# Altium schematic sheet 300_Externals.SchDoc: External_Components
size A4; Date: xxxxxxxx; DrawnBy: H.Y.Pabón; Revision: V1R0; SheetNumber: 4; SheetTotal: 4
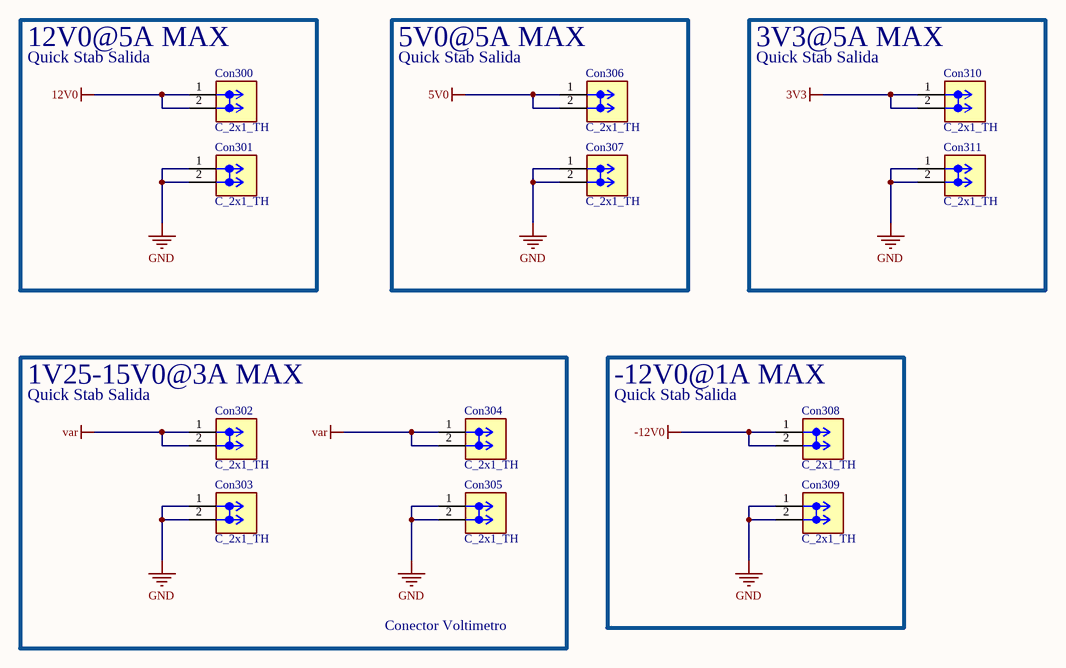
[diagram p0: 300_Externals.SchDoc]

## Parts
Con300  C_2x1_TH  [Con_2x1_TH_6.3mm]
Con301  C_2x1_TH  [Con_2x1_TH_6.3mm]
Con302  C_2x1_TH  [Con_2x1_TH_6.3mm]
Con303  C_2x1_TH  [Con_2x1_TH_6.3mm]
Con304  C_2x1_TH  [Con_2x1_TH_6.3mm]
Con305  C_2x1_TH  [Con_2x1_TH_6.3mm]
Con306  C_2x1_TH  [Con_2x1_TH_6.3mm]
Con307  C_2x1_TH  [Con_2x1_TH_6.3mm]
Con308  C_2x1_TH  [Con_2x1_TH_6.3mm]
Con309  C_2x1_TH  [Con_2x1_TH_6.3mm]
Con310  C_2x1_TH  [Con_2x1_TH_6.3mm]
Con311  C_2x1_TH  [Con_2x1_TH_6.3mm]

## Blocks framed on the sheet
12V0@5A MAX: Con300 Con301
5V0@5A MAX: Con306 Con307
3V3@5A MAX: Con310 Con311
1V25-15V0@3A MAX: Con302-Con305
-12V0@1A MAX: Con308 Con309

## Nets
3V3: Con310.1 Con310.2
5V0: Con306.1 Con306.2
12V0: Con300.1 Con300.2
-12V0: Con308.1 Con308.2
GND: Con301.1 Con301.2 Con303.1 Con303.2 Con305.1 Con305.2 Con307.1 Con307.2 Con309.1 Con309.2 Con311.1 Con311.2
var: Con302.1 Con302.2 Con304.1 Con304.2

## Notes on the sheet
- (near Con300) Quick Stab Salida
- (near Con306) Quick Stab Salida
- (near Con310) Quick Stab Salida
- (near Con302) Quick Stab Salida
- (near Con308) Quick Stab Salida
- Conector Voltimetro
- Title:
- Project:
- File:
- Revision:
- Date:
- Size:
- A4
- Drawn by:

## Library data of the parts
Con300-Con311 = Con_2x1_TH_6.3mm: Through Hole Quick Connects, Quick Disconnect Connectors RoHS; Manufacturer: TE Connectivity; Manufacturer Part Number: 2376591-2; Supplier 1: LCSC; Supplier Part Number 1: C3218571; Reel Stock: N/A; Last modified by: H.Y.Pabón; Last modified date: 20261111; ComponentLink1Description: LCSC; ComponentLink1URL: https://www.lcsc.com/es/product-detail/C3218571.html?s_z=n_q_2376591-2&spm=wm.fly.bg.0.xh&lcsc_vid=Q1RbAgBVRVQPAlZeQVRYVAdeFgVZXwFeTgNaVQJTEwUxVlNfQ1VaVVBVQVBcUTsOAxUeFF5JWBYZEEoKFBINSQcJGk4LFEsFFhULAAsUDk5fXldSWQkaCgg%3D; ComponentLink2Description: DataSheet; ComponentLink2URL: https://www.lcsc.com/datasheet/C3218571.pdf?spm=wm.sxq.inf.ggs___wm.fly.bg.0.xh&lcsc_vid=Q1RbAgBVRVQPAlZeQVRYVAdeFgVZXwFeTgNaVQJTEwUxVlNfQ1VaVVBVQVBcUTsOAxUeFF5JWBYZEEoKFBINSQcJGk4LFEsFFhULAAsUDk5fXldSWQkaCgg%3D